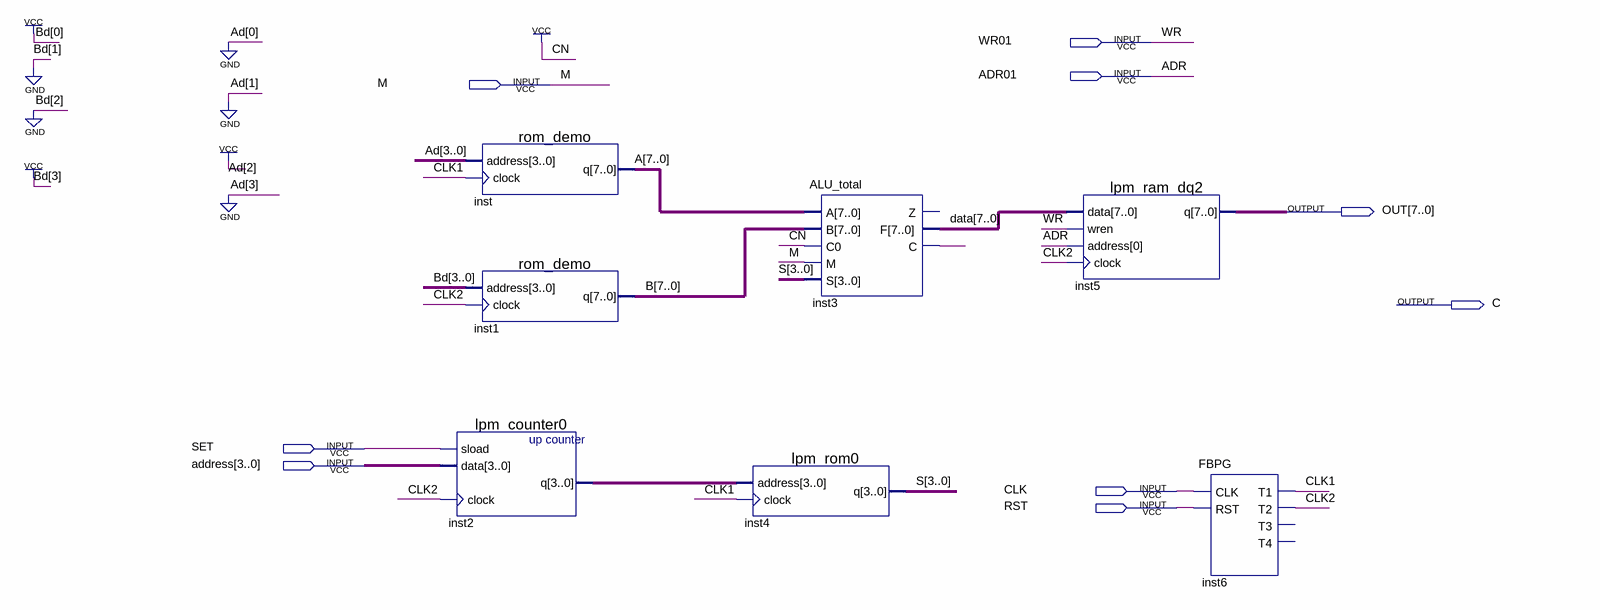
[diagram p0: schematic sheet]
// Quartus schematic exp4_cpu.bdf as structural Verilog: 7 symbols, 9 pins
module exp4_cpu (
  input  WR01,
  input  ADR01,
  input  M,
  input  SET,
  input  [3:0] address,
  input  CLK,
  input  RST,
  output [7:0] OUT,
  output C
);

  wire CLK1, CLK2, inst3_c;
  wire [3:0] inst2_q, S;
  wire [7:0] A, B, data;

  rom_demo inst (.address(4'b0100), .clock(CLK1), .q(A));
  rom_demo inst1 (.address(4'b1001), .clock(CLK2), .q(B));
  lpm_counter0 inst2 (.sload(SET), .data(address), .clock(CLK2), .q(inst2_q));
  lpm_rom0 inst4 (.address(inst2_q), .clock(CLK1), .q(S));
  ALU_total inst3 (.A(A), .B(B), .C0(1'b1), .M(M), .S(S), .F(data), .C(inst3_c));  // open: Z
  lpm_ram_dq2 inst5 (.data(data), .wren(WR01), .address(ADR01), .clock(CLK2), .q(OUT));
  FBPG inst6 (.CLK(CLK), .RST(RST), .T1(CLK1), .T2(CLK2));  // open: T3, T4

  // Other names for the same wires on the sheet: ADR = ADR01; WR = WR01
endmodule
